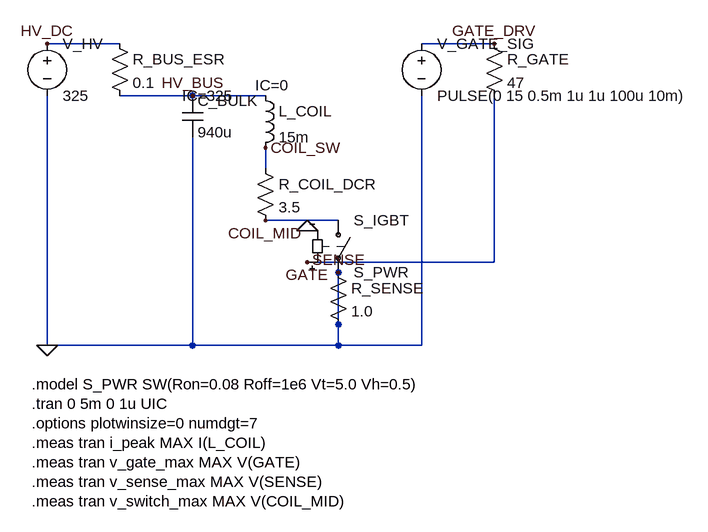
[diagram p0: schematic test_emc100_final.asc]
test_emc100_final.asc, the LTspice schematic file:
Version 4
SHEET 1 1280 800
WIRE 64 16 176 16
WIRE 176 96 288 96
WIRE 288 96 400 96
WIRE 64 96 64 480
WIRE 64 480 288 480
WIRE 288 160 288 480
WIRE 288 480 464 480
WIRE 464 480 512 480
WIRE 400 176 400 208
WIRE 400 288 512 288
WIRE 512 368 512 448
WIRE 512 448 512 480
WIRE 640 16 752 16
WIRE 640 96 640 480
WIRE 752 96 752 304
WIRE 752 304 752 352
WIRE 752 352 464 352
WIRE 512 480 640 480
FLAG 64 480 0
FLAG 64 16 HV_DC
FLAG 288 96 HV_BUS
FLAG 400 176 COIL_SW
FLAG 400 288 COIL_MID
FLAG 752 16 GATE_DRV
FLAG 464 352 GATE
FLAG 512 368 SENSE
SYMBOL voltage 64 0 R0
WINDOW 123 0 0 Left 2
WINDOW 39 0 0 Left 2
SYMATTR InstName V_HV
SYMATTR Value 325
SYMBOL res 160 0 R0
WINDOW 123 0 0 Left 2
WINDOW 39 0 0 Left 2
SYMATTR InstName R_BUS_ESR
SYMATTR Value 0.1
SYMBOL cap 272 96 R0
WINDOW 123 0 0 Left 2
WINDOW 39 0 0 Left 2
SYMATTR InstName C_BULK
SYMATTR Value 940u
SYMATTR SpiceLine IC=325
SYMBOL ind 384 80 R0
WINDOW 123 0 0 Left 2
WINDOW 39 0 0 Left 2
SYMATTR InstName L_COIL
SYMATTR Value 15m
SYMATTR SpiceLine IC=0
SYMBOL res 384 192 R0
WINDOW 123 0 0 Left 2
WINDOW 39 0 0 Left 2
SYMATTR InstName R_COIL_DCR
SYMATTR Value 3.5
SYMBOL sw 512 272 R0
WINDOW 123 0 0 Left 2
WINDOW 39 0 0 Left 2
SYMATTR InstName S_IGBT
SYMATTR Value S_PWR
SYMBOL res 496 352 R0
WINDOW 123 0 0 Left 2
WINDOW 39 0 0 Left 2
SYMATTR InstName R_SENSE
SYMATTR Value 1.0
SYMBOL voltage 640 0 R0
WINDOW 123 0 0 Left 2
WINDOW 39 0 0 Left 2
SYMATTR InstName V_GATE_SIG
SYMATTR Value PULSE(0 15 0.5m 1u 1u 100u 10m)
SYMBOL res 736 0 R0
WINDOW 123 0 0 Left 2
WINDOW 39 0 0 Left 2
SYMATTR InstName R_GATE
SYMATTR Value 47
TEXT 40 540 Left 2 !.model S_PWR SW(Ron=0.08 Roff=1e6 Vt=5.0 Vh=0.5)
TEXT 40 570 Left 2 !.tran 0 5m 0 1u UIC
TEXT 40 600 Left 2 !.options plotwinsize=0 numdgt=7
TEXT 40 630 Left 2 !.meas tran i_peak MAX I(L_COIL)
TEXT 40 660 Left 2 !.meas tran v_gate_max MAX V(GATE)
TEXT 40 690 Left 2 !.meas tran v_sense_max MAX V(SENSE)
TEXT 40 720 Left 2 !.meas tran v_switch_max MAX V(COIL_MID)
FLAG 464 304 0

The netlist it stands for:
* test_emc100_final.asc
V_HV HV_DC 0 325
R_BUS_ESR HV_DC HV_BUS 0.1
C_BULK HV_BUS 0 940u IC=325
L_COIL HV_BUS COIL_SW 15m IC=0
R_COIL_DCR COIL_SW COIL_MID 3.5
S_IGBT COIL_MID 0 GATE 0 S_PWR
R_SENSE 0 0 1.0
V_GATE_SIG GATE_DRV 0 PULSE(0 15 0.5m 1u 1u 100u 10m)
R_GATE GATE_DRV GATE 47
.model S_PWR SW(Ron=0.08 Roff=1e6 Vt=5.0 Vh=0.5)
.tran 0 5m 0 1u UIC
.options plotwinsize=0 numdgt=7
.meas tran i_peak MAX I(L_COIL)
.meas tran v_gate_max MAX V(GATE)
.meas tran v_sense_max MAX V(SENSE)
.meas tran v_switch_max MAX V(COIL_MID)
.backanno
.end